# Altium project QKD-LD-002.PrjPcb
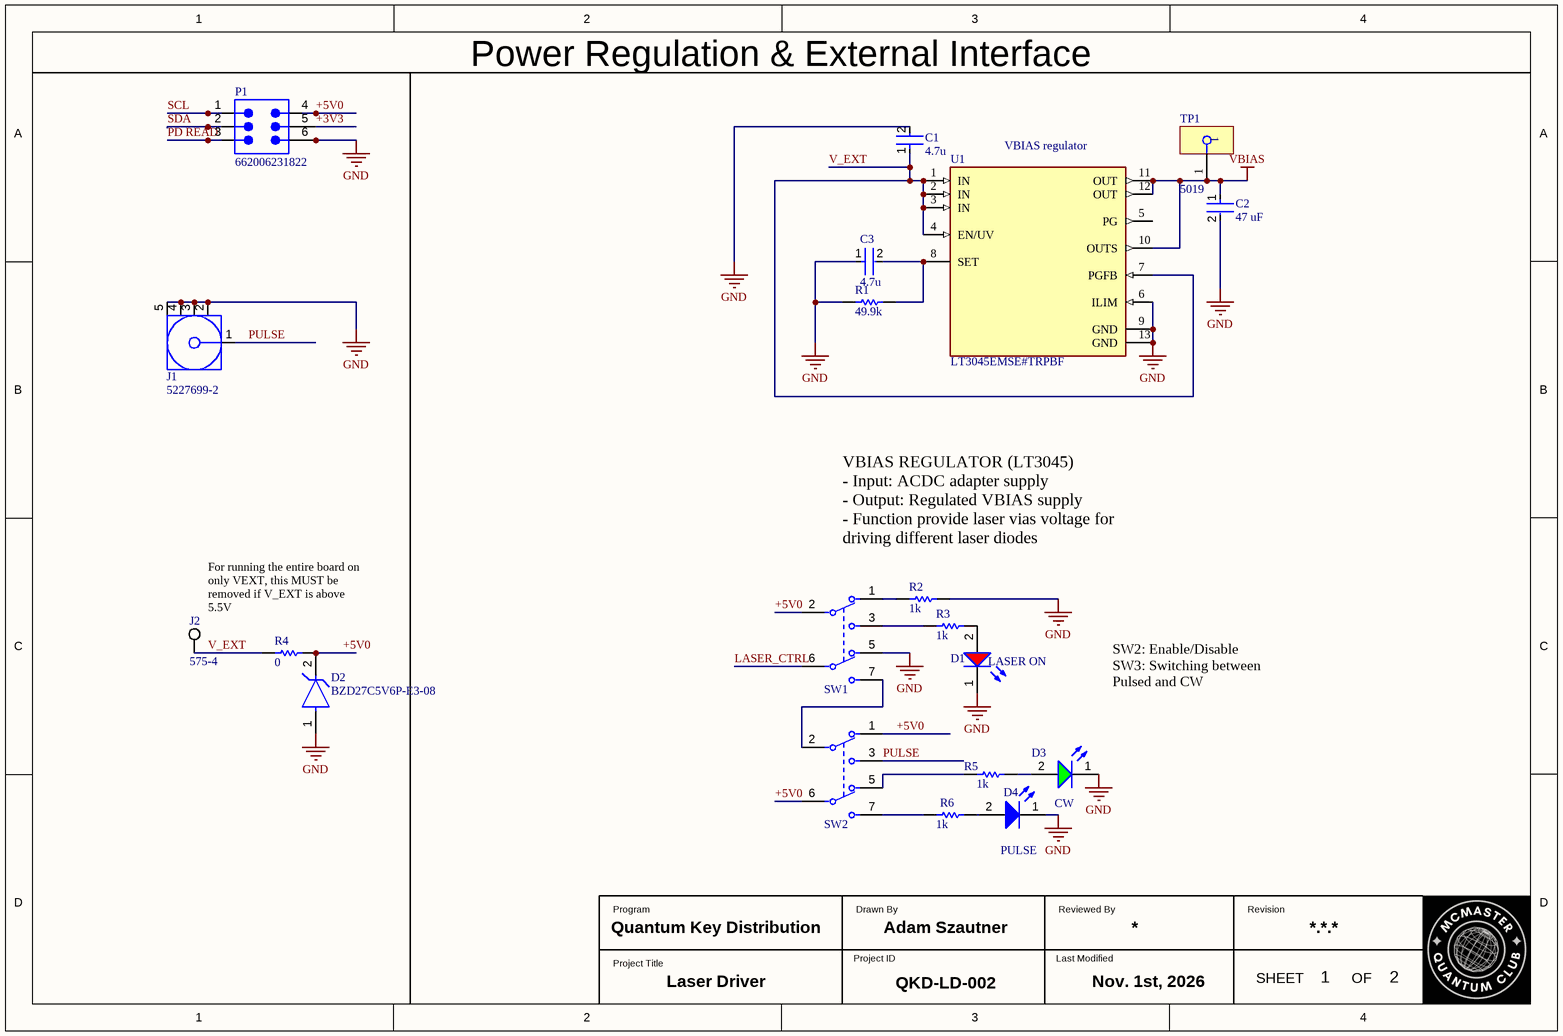
[diagram p0: Power Regulation and Interfaces.SchDoc]
DrawnBy: Adam Szautner; LastMod: Nov. 1st, 2026; PN: QKD-LD-002; Prg: Quantum Key Distribution; Prj: Laser Driver; Rev: 1.0
2 sheets, 43 parts. Net scope: global (net labels, ports and power ports of the same name join across sheets).
Board files: QKD-LD-002-OLD.PcbDoc, QKD-LD-002.PcbDoc
Sheets:
  Power Regulation and Interfaces.SchDoc
  Laser Driver.SchDoc

## Sheet Power Regulation and Interfaces.SchDoc
size A4; SPICEModelCacheAAATKUSZ: <root> / <DocumentId>AAATKUSZ</DocumentId> / </root>; Organization: ORGANIZATION; Address1: ADDRESS 1; Address2: ADDRESS 2; Address3: ADDRESS 3; Address4: ADDRESS 4; Revision: *.*.*; SheetNumber: 1; SheetTotal: 2

### Parts
C1  4.7u  [FP-CC0402-MFG]
C2  47 uF  [FP-GRM188-0_2-MFG]
C3  4.7u  [FP-CC0402-MFG]
D1  LASER ON  [WL-SMCW_0805_150080xx75000]
D2  BZD27C5V6P-E3-08  [FP-S8-V-3915_01-001-MFG]
D3  CW  [WL-SMCW_0805_150080xx75000]
D4  PULSE  [WL-SMCW_0805_150080xx75000]
J1  5227699-2  [TECO-5227699-2_V]
J2  575-4  [KSTN-575-4]
P1  662006231822  [662006231822]
R1  49.9k  [RESC1005X40X25NL05T05]
R2  1k  [RESC2013X60X35ML10T20]
R3  1k  [RESC2013X60X35ML10T20]
R4  0  [RESC1005X40X25NL05T10]
R5  1k  [RESC2013X60X35ML10T20]
R6  1k  [RESC2013X60X35ML10T20]
SW1  JS202011JCQN  [FP-JS202011JCQN-MFG]  (value not drawn)
SW2  JS202011JCQN  [FP-JS202011JCQN-MFG]  (value not drawn)
TP1  5019  [5019_MFG]
U1  LT3045EMSE#TRPBF  [FP-MSE-12-05-08-1666-IPC_B]

### Nets
GND: C1.2 C2.2 C3.1 D1.1(K) D2.1(A) D3.1(K) D4.1(K) J1.2 J1.3 J1.4 J1.5 P1.6 R1.1 R2.2 SW1.5 U1.6(ILIM) U1.9(GND) U1.13(GND)
VBIAS: C2.1 TP1.1 U1.10(OUTS) U1.11(OUT) U1.12(OUT)
+3V3: P1.5
+5V0: D2.2(C) P1.4 R4.2 SW1.2(1_C) SW2.1 SW2.6(2_C)
LASER_CTRL: SW1.6(2_C)
PD READ: P1.3
PULSE: J1.1 SW2.3
SCL: P1.1
SDA: P1.2
V_EXT: C1.1 J2.1 R4.1 U1.1(IN) U1.2(IN) U1.3(IN) U1.4(EN/UV) U1.7(PGFB)
NetC3_2: C3.2 R1.2 U1.8(SET)
NetD1_2: D1.2(A) R3.2
NetD3_2: D3.2(A) R5.2
NetD4_2: D4.2(A) R6.2
NetR2_1: R2.1 SW1.1
NetR3_1: R3.1 SW1.3
NetR5_1: R5.1 SW2.5
NetR6_1: R6.1 SW2.7
NetSW1_7: SW1.7 SW2.2(1_C)

Not connected (* = marked no-connect by the designer): U1 5(PG)

### Notes on the sheet
- Power Regulation & External Interface
- (near U1) VBIAS regulator
- Type @ to refer to a designator
- VBIAS REGULATOR (LT3045)
  - Input: ACDC adapter supply
  - Output: Regulated VBIAS supply
  - Function provide laser vias voltage for driving different laser diodes
- For running the entire board on only VEXT, this MUST be removed if V_EXT is above 5.5V
- (near D3) SW2: Enable/Disable
  SW3: Switching between Pulsed and CW
- Program
- Drawn By
- Reviewed By
- Revision
- Project Title
- Project ID
- Last Modified
- SHEET
- OF

### Library data of the parts
C1 C3 = CMP-03422-001389-1: CAP CER 4.7UF 6.3V X5R 0402; Manufacturer: YAGEO; Manufacturer Part Number: CC0402KRX5R5BB475; Automotive Grade: NA; Tolerance: 0.1; Temperature Coefficient: 30ppm/°C; Material: Ceramic; Category: Cap; Device Class L3: Ceramic Capacitors; Lead Free: Yes; ComponentLink2URL: http://www.yageo.com/documents/recent/UPY-GP_NP0_16V-to-50V_16.pdf; Value: 4.7 uF; Voltage Rating: 6.3 V; Device Class L1: Passive Components; Height: 0.55mm; Device Class L2: Capacitors; Octopart: https://octopart.com/cc0402krx5r5bb475-yageo-71498076; Temperature Characteristic: X5R; ComponentLink2Description: Datasheet; Temperature Range High: +125°C; Ipc Land Pattern Name: CAPC10050X50; RoHS: TRUE; Capacitance: 4.7 uF; Package: CC0402; Digikey Description: CAP CER 4.7UF 6.3V X5R 0402; Automotive: No; Mouser Description: 0402 4.7 uF 6.3 V ±10% Tolerance X5R SMT Multilayer Ceramic Capacitor; Temperature Range Low: -55°C; Temperature: -55°C to +125°C; Footprint Url: http://www.yageo.com/exep/pages/download/literatures/UPY-C_GEN_24.pdf
C2 = CMP-06035-023005-1: Chip Multilayer Ceramic Capacitors for General Purpose, 0603, 47uF, X5R, 15%, 20%, 6.3V
D1 = CMP-1426-00011-5: LED Uni-Color Red 630nm 2-Pin Chip 0805(2012Metric) T/R; Manufacturer Lifecycle Status: ACTIVE; Test Current: 20mA; Forward Voltage: 2V; YEOL: 1 = Estimated lifetime > 10 years; Lens Style: Clear, Rectangular; Max Junction Temperature (Tj): 95°C; Dominant Wavelength: 625nm; Max Reverse Voltage (DC): 5V; Power Dissipation: 72mW; Viewing Angle: 140°; Luminous Intensity: 150mcd; Forward Current: 100mA; Case/Package: 0805; Case Code (Imperial): 0805; RoHS: Compliant; Min Operating Temperature: -40°C; Packaging: Tape and Reel; Peak Wavelength: 630nm; REACH SVHC: Unknown; Max Operating Temperature: 85°C; Lifecycle Status: Production; Length: 2mm; Wavelength: 625nm; Mount: Surface Mount; Manufacturer Package Identifier: 0805 (2012 metric); Case Code (Metric): 2012; Width: 1.25mm; Color: Red; Height: 700µm
D2 = CMP-02541-000005-1: DIODE ZENER 5.6V 800MW DO219AB; Manufacturer: Vishay; Max Reverse Leakage Current: 10uA; Max Junction Temp: +175°C; Zener Impedance: 2Ω; Reverse Voltage: 2V; Forward Current: 0.2A; Max Zener Voltage: 6V; Standoff Height: 0mm; Automotive Grade: NA; Digikey Description: DIODE ZENER 5.6V 800MW DO219AB; Package: S8-V-3915.01-001; RoHS: TRUE; Octopart: https://octopart.com/bzd27c5v6p-e3-08-vishay-30317385; Nom Zener Voltage: 5.6V; Temperature Range Low: -65°C; ComponentLink2Description: Datasheet; ComponentLink2URL: http://www.vishay.com/docs/85153/bzd27series.pdf; Lead Free: Yes; Power Dissipation: 800mW; Manufacturer Part Number: BZD27C5V6P-E3-08; Category: Diode; Height: 1.08mm; Mouser Description: Diode Zener Single 5.6V 800mW 2-Pin DO-219AB T/R; Temperature: -65°C to +175°C; Device Class L2: Diodes; Device Class L3: Zener Diodes; Temperature Range High: +175°C; Automotive: No; Device Class L1: Discrete Semiconductors
D3 = CMP-1426-00007-5: WURTH ELEKTRONIK - 150080GS75000 - LED, Green, SMD, 0805, 30 mA, 3.2 V, 520 nm; Manufacturer Lifecycle Status: ACTIVE; Manufacturer Package Identifier: 0805 (2012 metric); Wavelength: 525nm; Test Current: 20mA; Luminous Intensity: 450mcd; Max Reverse Voltage (DC): 5V; YEOL: 1 = Estimated lifetime > 10 years; Power Dissipation: 105mW; Viewing Angle: 140°; Peak Wavelength: 515nm; Forward Voltage: 3.2V; Forward Current: 100mA; Lens Style: Clear, Rectangular; Max Junction Temperature (Tj): 95°C; Case/Package: 0805; Height: 700µm; Packaging: Tape and Reel; Max Operating Temperature: 85°C; Lifecycle Status: Production; REACH SVHC: Unknown; Length: 2mm; Width: 1.25mm; Mount: Surface Mount; Reverse Voltage: 5V; Dominant Wavelength: 525nm; Case Code (Metric): 2012; RoHS: Compliant; Case Code (Imperial): 0805; Color: Green; Min Operating Temperature: -40°C
D4 = CMP-1426-00008-9: Wurth Elektronik Blue LED, WL-SMCW Series, 0805 (2012), 470nm, 2x1.25x0.7mm; Manufacturer Lifecycle Status: ACTIVE; Manufacturer Package Identifier: 0805 (2012 metric); YEOL: 1 = Estimated lifetime > 10 years; Peak Wavelength: 465nm; Reverse Voltage: 5V; Lens Style: Clear, Rectangular; Luminous Intensity: 145mcd; Power Dissipation: 105mW; Test Current: 20mA; Viewing Angle: 140°; Forward Voltage: 3.2V; Max Junction Temperature (Tj): 95°C; Forward Current: 100mA; Length: 2mm; Width: 1.25mm; Min Operating Temperature: -40°C; Color: Blue; Packaging: Tape and Reel; Lifecycle Status: Production; Height: 700µm; REACH SVHC: Unknown; Case Code (Imperial): 0805; Mount: Surface Mount; Dominant Wavelength: 470nm; Wavelength: 470nm; Lead Free: Lead Free; Case/Package: 0805; Max Reverse Voltage (DC): 5V; Case Code (Metric): 2012; RoHS: Compliant; Max Operating Temperature: 85°C
J1 = CMP-2000-05627-1: Jack BNC Connector, 1 Position, Height 16.26 mm, Tail Length 6.35 mm, -55 to 85 degC, RoHS, Tube; Manufacturer: TE Connectivity; Frequency - Max: 4GHz; Dynamic Catalog: BNCConnectors; Connector Type: Jack,FemaleSockets; Other Names: A32269; Impedance: 50Ohm; 3D Model: 5227699-2.pdf; Contact Termination: Solder; Standard Package: 30; Mounting Technology: ThroughHole; Package Reference: 5227699-2; Category: Connectors,Interconnects; Datasheet URL: http://www.te.com/commerce/DocumentDelivery/DDEController?Action=showdoc&DocId=Customer+Drawing%7F5227699%7FA1%7Fpdf%7FEnglish%7FENG_CD_5227699_A1.pdf%7F5227699-2; Mounting Type: ThroughHole,Flange(Square); Datasheet Version: Rev. A1, 03/2011; Manufacturer URL: http://www.te.com/; RoHS Information: 5227699-2StatementofCompliance; Fastening Type: BayonetLock; Series: BNC; Connector Style: BNC; Family: CoaxialConnectors(RF); Packaging: Bulk; Package Description: Jack BNC Connector, 1 Position, Height 16.26 mm, Tail Length 6.35 mm
J2 = CMP-2000-05649-1: Banana Jack, Non-Insulated, 1-Pin THD, RoHS, Bulk; Manufacturer: Keystone-Electronics; Package Version: Rev. B, 11/1994; Plug/Mating Plug Diameter: StandardBanana; Gender: Female; Package Reference: 575-4; Operating Temperature: -; Contact Material: Brass; Packaging: Bulk; Series: -; Category: Connectors,Interconnects; Color: -; Type: BananaJack; Contact Finish: Nickel; Features: -; Family: BananaandTipConnectors-Jacks,Plugs; Body Material: -; Manufacturer URL: http://www.keyelco.com/; Termination: Solder; Insulation: Non-Insulated; Datasheet Version: Rev. B, 11/1994; Mounting Technology: ThroughHole; Package URL: http://www.keyelco.com/product-pdf.cfm?p=2379; Mounting Type: ThroughHole; Package Description: 1-Pin Through Hole Device, Dia 7.92 mm; Datasheet URL: http://www.keyelco.com/product-pdf.cfm?p=2379; Wire Gauge: -
P1 = CMP-1502-00342-3: Header, 3.00MM, SMT Male Dual Row Vertical, SMT Solder Tab, SMT, Tin, 6 Pins; Number of Positions: 6; Current Rating: 5A; Row Spacing: 2.9972mm; Pitch: 3mm; Contact Resistance: 10mΩ; Insulation Resistance: 1GΩ; Connector Type: Male Pin, Socket; Operating Supply Voltage: 250V; RoHS: Compliant; Termination: Solder; Contact Plating: Tin; Height: 9.9mm; Gender: Male; Color: Black; Min Operating Temperature: -40°C; Number of Contacts: 6; Length: 12.7mm; Lead Pitch: 3mm; Width: 12.7mm; Orientation: Vertical; Contact Material: Copper; Housing Material: Nylon; Number of Rows: 2; Max Operating Temperature: 105°C; Mount: Surface Mount; Number of Pins: 6; Fastening Type: Ramp
R1 = CMP-2002-00036-1: Manufacturer: Vishay Dale; Part Number: CRCW0402499KFKTD
R2 R3 R5 R6 = CMP-2100-03671-1: Chip Resistor, 1 KOhm, +/- 1%, 125 mW, -55 to 155 degC, 0805 (2012 Metric), RoHS, Tape and Reel; Manufacturer: Yageo; Temperature Coefficient: 100ppm/degreesC; Voltage Rating (DC): 150V; Max Power Dissipation: 125mW; Resistance: 1KOhm; Number of Pins: 2; Number of Terminations: 2; Datasheet URL: http://www.yageo.com/NewPortal/yageodocoutput?fileName=/pdf/R-Chip/PYu-RC_Group_51_RoHS_L_5.pdf; Length: 0.079inch; Package Description: 2-Pin Surface Mounted Device, Body 2 x 1.25 mm; Depth: 1.25mm; Height: 0.024inch; Military Standard: Not; Case/Package: 0805; Package Reference: 0805; RoHSCompliant: true; Lead Free: LeadFree; Packaging: TapeandReel; Package Quantity: 1; Datasheet Version: Rev. 5, 10/2016; Tolerance: 1%; Min Operating Temperature: -55degC; Voltage Rating: 150V; Composition: ThickFilm; Case Code (Imperial): 0805; Power Rating: 125mW; Width: 0.049inch; Case Code (Metric): 2012; Manufacturer URL: http://www.yageo.com/; Max Operating Temperature: 155degC; REACH SVHC: Unknown; Termination: SMD/SMT
R4 = CMP-1011-00001-2: Manufacturer: Yageo / Phycomp; Part Number: RC0402JR-070RL
SW1 SW2 = CMP-10038-000009-1: SWITCH SLIDE DPDT 300MA 6V; Actuator Material: Nylon; Actuator Length: 2mm; Actuator Type: Standard; Electrical Life: 5000Cycles; Switch Function: On-On; Mount: Surface Mount; Current Rating: 300mA; Contact Material: Copper Alloy; Voltage Rating (DC): 6V; Throw Configuration: DPDT; Packaging: Cut Tape; Contact Plating: Silver; Min Operating Temperature: -40°C; Switch Travel: 2mm; Max Operating Temperature: 85°C
TP1 = CMP-1672-00008-3: Phosphor Bronze Contact Miniature Silver Plated Surface Mount Test Points; Number of Contacts: 1; ComponentLink1Description: Manufacturer's Website; Number of Pins: 1; Height: 2.42mm; Mount: Surface Mount; HelpURL: https://www.keyelco.com/product-pdf.cfm?p=1357; REACH SVHC: Yes; Packaging: Tape and Reel; Lead Free: Lead Free; ComponentLink1URL: http://www.keyelco.com/; Termination: SMD/SMT; Material: Bronze; Contact Plating: Silver; Contact Material: Silver; RoHS: Compliant; ComponentLink2URL: https://www.keyelco.com/product-pdf.cfm?p=1357; China RoHS: Compliant; Lifecycle Status: Production; ComponentLink2Description: Datasheet URL
U1 = CMP-09138-000053-1: IC REG LINEAR 0V 500MA 12MSOP; Case/Package: MSOP; RoHS Compliant: Yes

## Sheet Laser Driver.SchDoc
size A4; DrawnBy: Adam Szautner; Revision: 1.0; SheetNumber: 2; SheetTotal: 2; Prg: Quantum Key Distribution; PrJ: Laser Driver; PN: QKD-LD-002
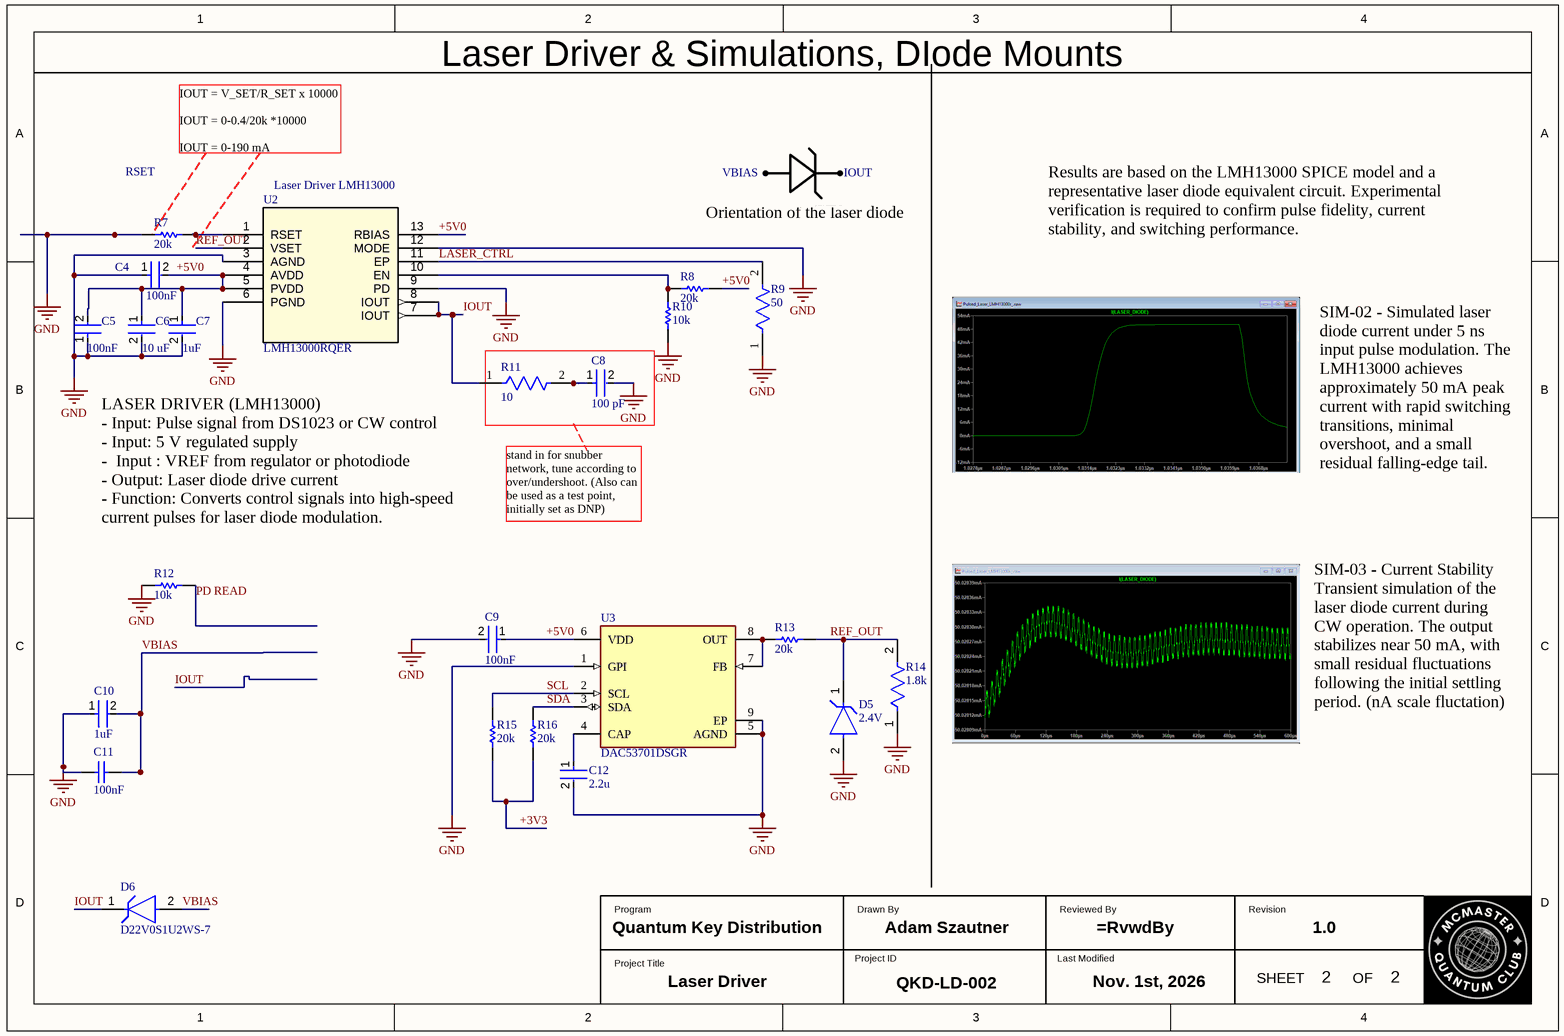
[diagram p1: Laser Driver.SchDoc]

### Parts
C4  100nF  [FP-C0402-BB-MFG]
C5  100nF  [FP-C0402-BB-MFG]
C6  10 uF  [FP-GRM155-0_2-IPC_C]
C7  1uF  [FP-0402-L_1_0_0_05-W_0_5-MFG]
C8  100 pF  [FP-C0402-BB-MFG]
C9  100nF  [FP-C0402-BB-MFG]
C10  1uF  [FP-0402-L_1_0_0_05-W_0_5-MFG]
C11  100nF  [CAPC2013X145X50LL20T20]
C12  2.2u  [FP-GRM155-0_15-MFG]
D5  2.4V  [FP-SOD323-IPC_B]
D6  D22V0S1U2WS-7  [FP-SOD323-IPC_B]
R7  20k  [RESC1005X40X25ML05T05]
R8  20k  [RESC1005X40X25ML05T05]
R9  50  [FP-RT0402-0_35-MFG]
R10  10k  [RESC1005X40X25LL10T10]
R11  10  [FP-TFCR0603-IPC_B]
R12  10k  [RESC1005X40X25LL10T10]
R13  20k  [RESC1005X40X25ML05T05]
R14  1.8k  [FP-RN73R1E-IPC_C]
R15  20k  [RESC1005X40X25ML05T05]
R16  20k  [RESC1005X40X25ML05T05]
U2  LMH13000RQER  [XLMH13000RQER.A_WQFN-HR_TXI_TEX]
U3  DAC53701DSGR  [FP-DSG0008A-IPC_B]

### Nets
GND: C4.1 C5.1 C6.2 C7.2 C8.2 C9.2 C10.1 C11.1 C12.2 D5.2(A) R7.1 R9.1 R10.1 R12.1 R14.1 U2.3(AGND) U2.6(PGND) U2.9(PD) U2.12(MODE) U3.1(GPI) U3.5(AGND) U3.9(EP)
VBIAS: C10.2 C11.2 D6.2(A)
+3V3: R15.2 R16.2
+5V0: C4.2 C5.2 C6.1 C7.1 C9.1 R8.2 U2.4(AVDD) U2.5(PVDD) U2.13(RBIAS) U3.6(VDD)
IOUT: D6.1(C) R11.1 U2.7(IOUT) U2.8(IOUT)
LASER_CTRL: R9.2 U2.11(EP)
PD READ: R12.2
REF_OUT: D5.1(C) R13.2 R14.2 U2.2(VSET)
SCL: R15.1 U3.2(SCL)
SDA: R16.1 U3.3(SDA)
NetC8_1: C8.1 R11.2
NetC12_1: C12.1 U3.4(CAP)
NetR7_2: R7.2 U2.1(RSET)
NetR8_1: R8.1 R10.2 U2.10(EN)
NetR13_1: R13.1 U3.7(FB) U3.8(OUT)

### Notes on the sheet
- Laser Driver & Simulations, DIode Mounts
- RSET
- IOUT = V_SET/R_SET x 10000
  IOUT = 0-0.4/20k *10000
  IOUT = 0-190 mA
- VBIAS
- IOUT
- (near U2) Laser Driver LMH13000
- Orientation of the laser diode
- Results are based on the LMH13000 SPICE model and a representative laser diode equivalent circuit. Experimental verification is required to confirm pulse fidelity, current stability, and switching performance.
- stand in for snubber network, tune according to over/undershoot. (Also can be used as a test point, initially set as DNP)
- SIM-02 - Simulated laser diode current under 5 ns input pulse modulation. The LMH13000 achieves approximately 50 mA peak current with rapid switching transitions, minimal overshoot, and a small residual falling-edge tail.
- LASER DRIVER (LMH13000)
  - Input: Pulse signal from DS1023 or CW control
  - Input: 5 V regulated supply
  -  Input : VREF from regulator or photodiode
  - Output: Laser diode drive current
  - Function: Converts control signals into high-speed current pulses for laser diode modulation.
- SIM-03 - Current Stability
  Transient simulation of the laser diode current during CW operation. The output stabilizes near 50 mA, with small residual fluctuations following the initial settling period. (nA scale fluctation)
- Labels drawn without touching a wire or pin: \
- Program
- Drawn By
- Reviewed By
- Revision
- Project Title
- Project ID
- Last Modified
- SHEET
- OF

### Library data of the parts
C4 C5 C9 = CMP-1034-02069-4: CAP CER 0.1UF 16V 10% X5R 0402; Manufacturer Part Number: C0402C104K4PACTU; Manufacturer: Kemet; Tolerance: 0.1; Value: 0.10 μF; Temperature Coefficient: 15%; Material: Ceramic; Package: C0402-BB; Lead Free: Yes; Voltage Rating: 16 V; Temperature Characteristic: X5R; ComponentLink2URL: https://content.kemet.com/datasheets/KEM_C1002_X7R_SMD.pdf; ComponentLink2Description: Datasheet; Temperature Range Low: -55°C; Device Class L2: Capacitors; Octopart: https://octopart.com/c0402c104k4pactu-kemet-8375715; Device Class L1: Passive Components; Automotive: No; Height: 0.55mm; Mouser Description: Multilayer Ceramic Capacitors MLCC - SMD/SMT 16volts 0.1uF 10% X5R; Digikey Description: CAP CER 0.1UF 16V 10% X5R 0402; Temperature: -55°C to +125°C; Capacitance: 0.10 μF; Device Class L3: Ceramic Capacitors; Temperature Range High: +125°C; RoHS: TRUE; Category: Cap; Ipc Land Pattern Name: CAPC10050X50
C6 = CMP-06035-053439-1: Chip Multilayer Ceramic Capacitors for General Purpose, 0402, 10uF, X5R, 15%, 20%, 10V
C7 C10 = CMP-14477-003599-2: None; RoHS Compliant: Yes
C8 = CMP-03020-017256-1: C0402 100 pF U2J 2.00% 10 V; Manufacturer Part Number: C0402C101G8JACAUTO; Manufacturer: Kemet; Tolerance: 0.02; Material: Ceramic; Temperature Coefficient: 15%; Voltage Rating: 10 V; Device Class L3: Ceramic Capacitors; RoHS: TRUE; Category: Cap; ComponentLink2URL: https://content.kemet.com/datasheets/KEM_C1002_X7R_SMD.pdf; Octopart: https://octopart.com/c0402c101g8jacauto-kemet-84730079; Ipc Land Pattern Name: CAPC10050X50; Temperature Range High: +125°C; Temperature Characteristic: U2J; Automotive: No; Temperature Range Low: -55°C; Value: 100 pF; Package: C0402-BB; Device Class L1: Passive Components; Height: 0.55mm; Temperature: -55°C to +125°C; ComponentLink2Description: Datasheet; Lead Free: Yes; Capacitance: 100 pF; Device Class L2: Capacitors
C11 = CMP-2007-01396-1: Part Number: VJ0805Y104JXXPW1BC; Manufacturer: Vitramon
C12 = CMP-06035-015498-1: Chip Multilayer Ceramic Capacitors for General Purpose, 0402, 2.2uF, X7T, +22%/-33%, 20%, 16V
D5 = CMP-12792-000028-1: DIODE ZENER 2.4V 200MW SOD323; Impedance: 100R; Zener Current: 5mA; Max Reverse Leakage Current: 50uA; ESD Protection: No; Output Current: 50mA; Tolerance: 8%; Element Configuration: Single; Number of Pins: 2; Max Operating Temperature: 150°C; Contact Plating: Tin; Min Operating Temperature: -65°C; REACH SVHC: No SVHC; Power Dissipation: 200mW; Test Current: 5mA; Peak Reverse Current: 50uA; Height: 1mm; Radiation Hardening: No; Termination: SMD/SMT; Power Rating: 200mW; Package Quantity: 3000; Zener Voltage: 2.4V; Max Power Dissipation: 200mW; Lead Free: Lead Free; Weight: 0.000173oz; Width: 1.4mm; Voltage Tolerance: 8%; Voltage Rating (DC): 2.4V; Packaging: Tape and Reel; Mount: Surface Mount; Length: 1.8mm
D6 = CMP-12828-000026-1: TVS DIODE 22V 37V SOD323; Power Line Protection: No; Peak Pulse Power: 1kW; Number of Unidirectional Channels: 1; Peak Pulse Current: 30A; Min Breakdown Voltage: 24V; Composition: Zener; Clamping Voltage: 37V; Mount: Surface Mount; Reverse Standoff Voltage: 22V; Max Operating Temperature: 125°C; Min Operating Temperature: -55°C; Packaging: Tape and Reel
R7 R8 R13 R15 R16 = CMP-2002-08357-1: Manufacturer: Vishay Dale; Part Number: CRCW040220K0FKTD
R9 = CMP-00621-71392720-1: RT0402BRE0750RL Fixed Resistor, Thin Film, 0.0625W, 50ohm, 50V, 0.1% +/-Tol, 50ppm/Cel, Surface Mount, 0402; Max Power Dissipation: 63mW; Temperature Coefficient: 50ppm/°C; Resistance: 50Ω; Features: Moisture Resistant; Max Operating Temperature: 155°C; Tolerance: 0.1%; Min Operating Temperature: -55°C; Case/Package: 0402; Packaging: Tape & Reel; RoHS: Compliant; Width: 508µm; Height: 355.6µm; NexarPartId: 71392720; Composition: Thin Film; Length: 990.6µm; Number of Terminations: 2
R10 R12 = CMP-2002-04584-1: Manufacturer: KOA Speer; Part Number: SG73P1ETTP1002F
R11 = CMP-250906-269177-1: RES Thin Film,  10Ω, 0.5%, 0.1W, 50ppm/°C, 0603
R14 = CMP-04015-046155-1: 1.8kΩ ±0.1% 0.063W, 1/16W Chip Resistor 0402 (1005 Metric) Moisture Resistant Thin Film
U2 = LMH13000RQER: High-speed, voltage-controlled current output driver 13-WQFN-HR -40 to 125; Manufacturer_Name: Texas Instruments; Copyright: Copyright (C) 2025 Ultra Librarian. All rights reserved.; Manufacturer_Part_Number: LMH13000RQER; RefDes: RefDes; Type: Type
U3 = CMP-04861-000027-1: 10-Bit and 8-Bit, Voltage-Output Smart DACs With Nonvolatile Memory and PMBus™ Compatible I2C Interface With GPI Control; RoHS Compliant: Yes

## Nets that join several sheets
GND: Power Regulation and Interfaces (18 pins), Laser Driver (22 pins)
VBIAS: Power Regulation and Interfaces (5 pins), Laser Driver (C10.2 C11.2 D6.2)
+3V3: Power Regulation and Interfaces (P1.5), Laser Driver (R15.2 R16.2)
+5V0: Power Regulation and Interfaces (6 pins), Laser Driver (10 pins)
LASER_CTRL: Power Regulation and Interfaces (SW1.6), Laser Driver (R9.2 U2.11)
PD READ: Power Regulation and Interfaces (P1.3), Laser Driver (R12.2)
SCL: Power Regulation and Interfaces (P1.1), Laser Driver (R15.1 U3.2)
SDA: Power Regulation and Interfaces (P1.2), Laser Driver (R16.1 U3.3)

## Assembly variants
Assembly: not fitted C9 D5 R9